# Altium schematic sheet VI.SchDoc
size A4
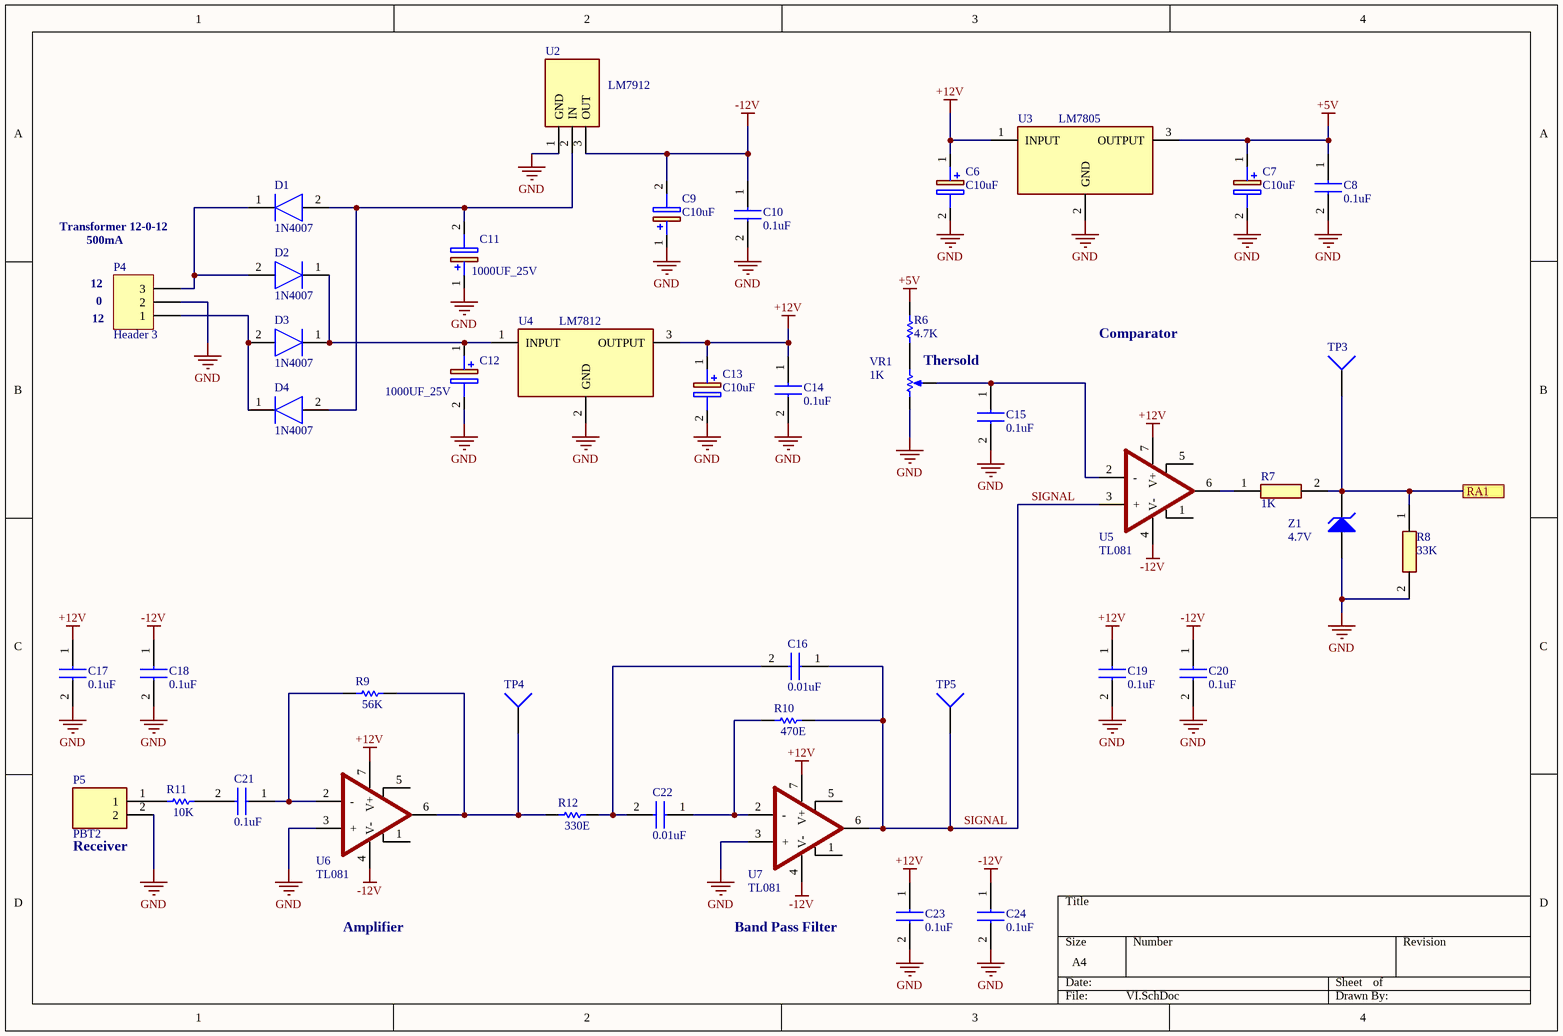
[diagram p0: VI.SchDoc]

## Parts
C6  C10uF  [CAPPRD250W50D680H1250]
C7  C10uF  [CAPPRD250W50D680H1250]
C8  0.1uF  [RESC3216X75N]
C9  C10uF  [CAPPRD250W50D680H1250]
C10  0.1uF  [RESC3216X75N]
C11  1000UF_25V  [CAPPRD500W60D1300H2650]
C12  1000UF_25V  [CAPPRD500W60D1300H2650]
C13  C10uF  [CAPPRD250W50D680H1250]
C14  0.1uF  [RESC3216X75N]
C15  0.1uF  [1C10X7R104K050B]
C16  0.01uF  [1C10X7R104K050B]
C17  0.1uF  [1C10X7R104K050B]
C18  0.1uF  [1C10X7R104K050B]
C19  0.1uF  [1C10X7R104K050B]
C20  0.1uF  [1C10X7R104K050B]
C21  0.1uF  [1C10X7R104K050B]
C22  0.01uF  [1C10X7R104K050B]
C23  0.1uF  [1C10X7R104K050B]
C24  0.1uF  [1C10X7R104K050B]
D1  1N4007  [DIOAD1165W56L425D185]
D2  1N4007  [DIOAD1165W56L425D185]
D3  1N4007  [DIOAD1165W56L425D185]
D4  1N4007  [DIOAD1165W56L425D185]
P4  Header 3  [HDR1X3]
P5  PBT2  [TB00750802BE]
R6  value 4.7K  [AXIAL-0.3]  (hidden comment: Res1)
R7  1K  [RESC3216X75N]
R8  33K  [RESC3216X75N]
R9  value 56K  [AXIAL-0.3]  (hidden comment: Res1)
R10  value 470E  [AXIAL-0.3]  (hidden comment: Res1)
R11  value 10K  [AXIAL-0.3]  (hidden comment: Res1)
R12  value 330E  [AXIAL-0.3]  (hidden comment: Res1)
TP3  Socket  [PIN1]  (value not drawn)
TP4  Socket  [PIN1]  (value not drawn)
TP5  Socket  [PIN1]  (value not drawn)
U2  LM7912  [TO254P470X1016X2019-3P]
U3  LM7805  [TO254P470X1028X1955-3P]
U4  LM7812  [TO254P470X1028X1955-3P]
U5  TL081  [DIP794W53P254L959H508Q8N]
U6  TL081  [DIP794W53P254L959H508Q8N]
U7  TL081  [DIP794W53P254L959H508Q8N]
VR1  value 1K  [VR5]  (hidden comment: RPot)
Z1  4.7V  [DIODE-0.7]

## Ports
RA1

## Nets
+5V: C7.1(+) C8.1 R6.2 U3.3(OUTPUT)
+12V: C6.1(+) C13.1(+) C14.1 C17.1 C19.1 C23.1 U3.1(INPUT) U4.3(OUTPUT) U5.7(V+) U6.7(V+) U7.7(V+)
-12V: C9.2(-) C10.1 C18.1 C20.1 C24.1 U2.3(OUT) U5.4(V-) U6.4(V-) U7.4(V-)
GND: C6.2(-) C7.2(-) C8.2 C9.1(+) C10.2 C11.1(+) C12.2(-) C13.2(-) C14.2 C15.2 C17.2 C18.2 C19.2 C20.2 C23.2 C24.2 P4.2 P5.2 R8.2 U2.1(GND) U3.2(GND) U4.2(GND) U6.3(+) U7.3(+) VR1.1(TOP) Z1.1(A)
RA1: R7.2 R8.1 TP3.1 Z1.2(K) ; port RA1
SIGNAL: C16.1 R10.2 TP5.1 U5.3(+) U7.6(OUTPUT)
NetC11_2: C11.2(-) D1.2(A) D4.2(A) U2.2(IN)
NetC12_1: C12.1(+) D2.1(K) D3.1(K) U4.1(INPUT)
NetC15_1: C15.1 U5.2(-) VR1.3(TAP)
NetC16_2: C16.2 C22.2 R12.2
NetC21_1: C21.1 R9.1 U6.2(-)
NetC21_2: C21.2 R11.2
NetC22_1: C22.1 R10.1 U7.2(-)
NetD1_1: D1.1(K) D2.2(A) P4.3
NetD3_2: D3.2(A) D4.1(K) P4.1
NetP5_1: P5.1 R11.1
NetR6_1: R6.1 VR1.2(BOT)
NetR7_1: R7.1 U5.6(OUTPUT)
NetR9_2: R9.2 R12.1 TP4.1 U6.6(OUTPUT)

Not connected (* = marked no-connect by the designer): U5 1(OFFSET_NULL_1) 5(OFFSET_NULL_2); U6 1(OFFSET_NULL_1) 5(OFFSET_NULL_2); U7 1(OFFSET_NULL_1) 5(OFFSET_NULL_2)

## Notes on the sheet
- Transformer 12-0-12
- 500mA
- (near P4) 12
- (near P4) 0
- (near VR1) Thersold
- Comparator
- (near P5) Receiver
- Amplifier
- Band Pass Filter

## Library data of the parts
C6 C7 C9 C13 = C10uF_ThruHole: Capacitor Polarised; Manufacturer_Name: Rubycon; Manufacturer_Part_Number: 100YXF10MEFC6.3X11; Datasheet Link: https://componentsearchengine.com/Datasheets/2/100YXF10MEFC6.3X11.pdf; Height: 12.5mm; Arrow Part Number: 100YXF10MEFC6.3X11; Arrow Price/Stock: https://www.arrow.com/en/products/100yxf10mefc6.3x11/rubycon; Mouser Part Number: 232-100YXF10MEFC63X1; Mouser Price/Stock: https://www.mouser.co.uk/ProductDetail/Rubycon/100YXF10MEFC63X11?qs=T3oQrply3y9i7TRjfOdsfg%3D%3D
C8 C10 C14 = C1206: Capacitor; Manufacturer_Name: TDK; Manufacturer_Part_Number: C3216C0G1H103J060AA; Datasheet Link: https://product.tdk.com/info/en/catalog/datasheets/mlcc_commercial_midvoltage_en.pdf; Height: 0.75mm; Mouser Part Number: 810-C3216C0G1H103J-1; Mouser Price/Stock: https://www.mouser.co.uk/ProductDetail/TDK/C3216C0G1H103J060AA?qs=LcTL%2F5vFEzGNu8aMmVNq%252Bg%3D%3D; RS Part Number: 7407467P; RS Price/Stock: http://uk.rs-online.com/web/p/products/7407467P
C11 C12 = C1000UF_25V: Capacitor Polarised; Manufacturer_Name: United Chemi-Con; Manufacturer_Part_Number: EKY-350ELL102MK25S; Datasheet Link: https://www.mouser.com/datasheet/2/420/United-Chemi-Con-1109128.pdf; Height: 26.5mm; Arrow Part Number: EKY-350ELL102MK25S; Arrow Price/Stock: https://www.arrow.com/en/products/eky-350ell102mk25s/united-chemi-con; Mouser Part Number: 661-EKY350ELL102MK2; Mouser Price/Stock: https://www.mouser.com/Search/Refine.aspx?Keyword=661-EKY350ELL102MK2
C15-C24 = Cap_Disc_TH: Capacitor; Manufacturer_Name: Vishay; Datasheet Link: https://componentsearchengine.com/Datasheets/2/1C10X7R104K050B.pdf; Height: 6.35mm; Manufacturer_Part_Number: 1C10X7R104K050B; Arrow Part Number: 1C10X7R104K050B; Arrow Price/Stock: https://www.arrow.com/en/products/1c10x7r104k050b/vishay; Mouser Part Number: 75-1C10X7R104K050B; Mouser Price/Stock: https://www.mouser.co.uk/ProductDetail/Vishay/1C10X7R104K050B?qs=TIBb6vrNf0T8HspN1t%2FgBg%3D%3D
D1-D4 = 1N4148: Diode; Manufacturer_Name: Nexperia; Datasheet Link: http://www.nxp.com/documents/data_sheet/1N4148_1N4448.pdf; Manufacturer_Part_Number: 1N4148
P4 = Header 3: Header, 3-Pin; LatestRevisionDate: 17-Jul-2002; LatestRevisionNote: Re-released for DXP Platform.; Publisher: Altium Limited
P5 = PBT2: Connector; Manufacturer_Name: CUI Devices; Manufacturer_Part_Number: TB007-508-02BE; Datasheet Link: https://www.mouser.com/datasheet/2/670/tb007-508-1550621.pdf; Height: 14mm; Arrow Part Number: TB007-508-02BE; Arrow Price/Stock: https://www.arrow.com/en/products/tb007-508-02be/cui-devices; Mouser Part Number: 490-TB007-508-02BE; Mouser Price/Stock: https://www.mouser.co.uk/ProductDetail/CUI-Devices/TB007-508-02BE?qs=vLWxofP3U2y6PFKAfCqKUQ%3D%3D
R6 R9-R12 = Res1: Resistor; Published: 8-Jun-2000; LatestRevisionDate: 17-Jul-2002; LatestRevisionNote: Re-released for DXP Platform.; PackageReference: AXIAL-0.3; Publisher: Altium Limited; PackageDescription: Axial Device, Thru-Hole; 2 Leads; 0.3 in Pin Spacing
R7 R8 = R1206: Resistor; Manufacturer_Name: Bourns; Manufacturer_Part_Number: CR1206-FX-1001ELF; Allied_Number: 70155095; Datasheet Link: http://www.bourns.com/data/global/pdfs/CHPREZTR.pdf; Height: 0.75mm; Mouser Part Number: 652-CR1206FX-1001ELF; Mouser Price/Stock: https://www.mouser.com/Search/Refine.aspx?Keyword=652-CR1206FX-1001ELF; RS Part Number: 7409088P; RS Price/Stock: http://uk.rs-online.com/web/p/products/7409088P; Allied Price/Stock: http://www.alliedelec.com/bourns-cr1206-fx-1001elf/70155095/
U2 = LM7915CT: Integrated Circuit; Manufacturer_Name: ON Semiconductor; Datasheet Link: http://www.onsemi.com/pub/Collateral/LM7918-D.pdf; Height: 4.7mm; Manufacturer_Part_Number: LM7915CT; Mouser Part Number: 512-LM7915CT; Mouser Price/Stock: https://www.mouser.co.uk/ProductDetail/ON-Semiconductor-Fairchild/LM7915CT?qs=AxPfoIcMNKKE4cliBai9zA%3D%3D; Arrow Part Number: LM7915CT; Arrow Price/Stock: https://www.arrow.com/en/products/lm7915ct/on-semiconductor
U3 U4 = LM7815CT: Integrated Circuit; Manufacturer_Name: Texas Instruments; Datasheet Link: http://www.ti.com/lit/ds/symlink/lm340.pdf; Height: 4.7mm; Manufacturer_Part_Number: LM7815CT; Mouser Part Number: 926-LM7815CT; Mouser Price/Stock: https://www.mouser.co.uk/ProductDetail/Texas-Instruments/LM7815CT?qs=QbsRYf82W3FGdlGQoRPhHw%3D%3D
U5-U7 = LM741_DIP: Integrated Circuit; Manufacturer_Name: Texas Instruments; Manufacturer_Part_Number: LM741CN/NOPB-936607701; Datasheet Link: https://www.arrow.com/en/products/lm741cnnopb-936607701/texas-instruments; Height: 5.08mm; Arrow Part Number: LM741CN/NOPB-936607701; Arrow Price/Stock: https://www.arrow.com/en/products/lm741cnnopb-936607701/texas-instruments
VR1 = RPot: Potentiometer; Sim Note: Enter the Resistance value and the set point into parameter fields.; Set Position: 0.5; Published: 8-Jun-2000; LatestRevisionDate: 17-Jul-2002; LatestRevisionNote: Re-released for DXP Platform.; PackageReference: VR5; Publisher: Altium Limited; PackageDescription: Variable Resistor, Thru-Hole; 3 Leads
Z1 = D Zener: Zener Diode; Published: 8-Jun-2000; LatestRevisionDate: 17-Jul-2002; LatestRevisionNote: Re-released for DXP Platform.; PackageReference: DIODE-0.7; Publisher: Altium Limited; PackageDescription: Diode, Thru-Hole; 2 Leads; 0.7 in Pin Spacing
TP3-TP5 = Socket: LatestRevisionDate: 17-Jul-2002; LatestRevisionNote: Re-released for DXP Platform.; Publisher: Altium Limited